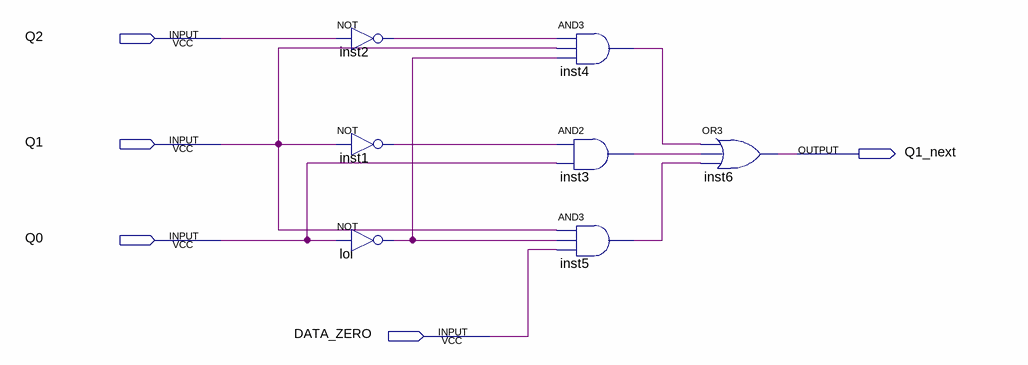
[diagram p0: schematic sheet]
// Quartus schematic Q1_next.bdf as structural Verilog: 7 symbols, 5 pins
module Q1_next (
  input  Q2,
  input  Q1,
  input  Q0,
  input  DATA_ZERO,
  output Q1_next
);

  wire inst1_out, inst2_out, inst3_out, inst4_out, inst5_out, lol_out;

  not inst2 (inst2_out, Q2);
  not inst1 (inst1_out, Q1);
  not lol (lol_out, Q0);
  and inst4 (inst4_out, inst2_out, Q1, lol_out);
  and inst3 (inst3_out, inst1_out, Q0);
  and inst5 (inst5_out, Q1, lol_out, DATA_ZERO);
  or inst6 (Q1_next, inst4_out, inst3_out, inst5_out);
endmodule
